# Altium project TYPEC_4KTransmitter-v1.0.PrjPcb (part 11 of 11)
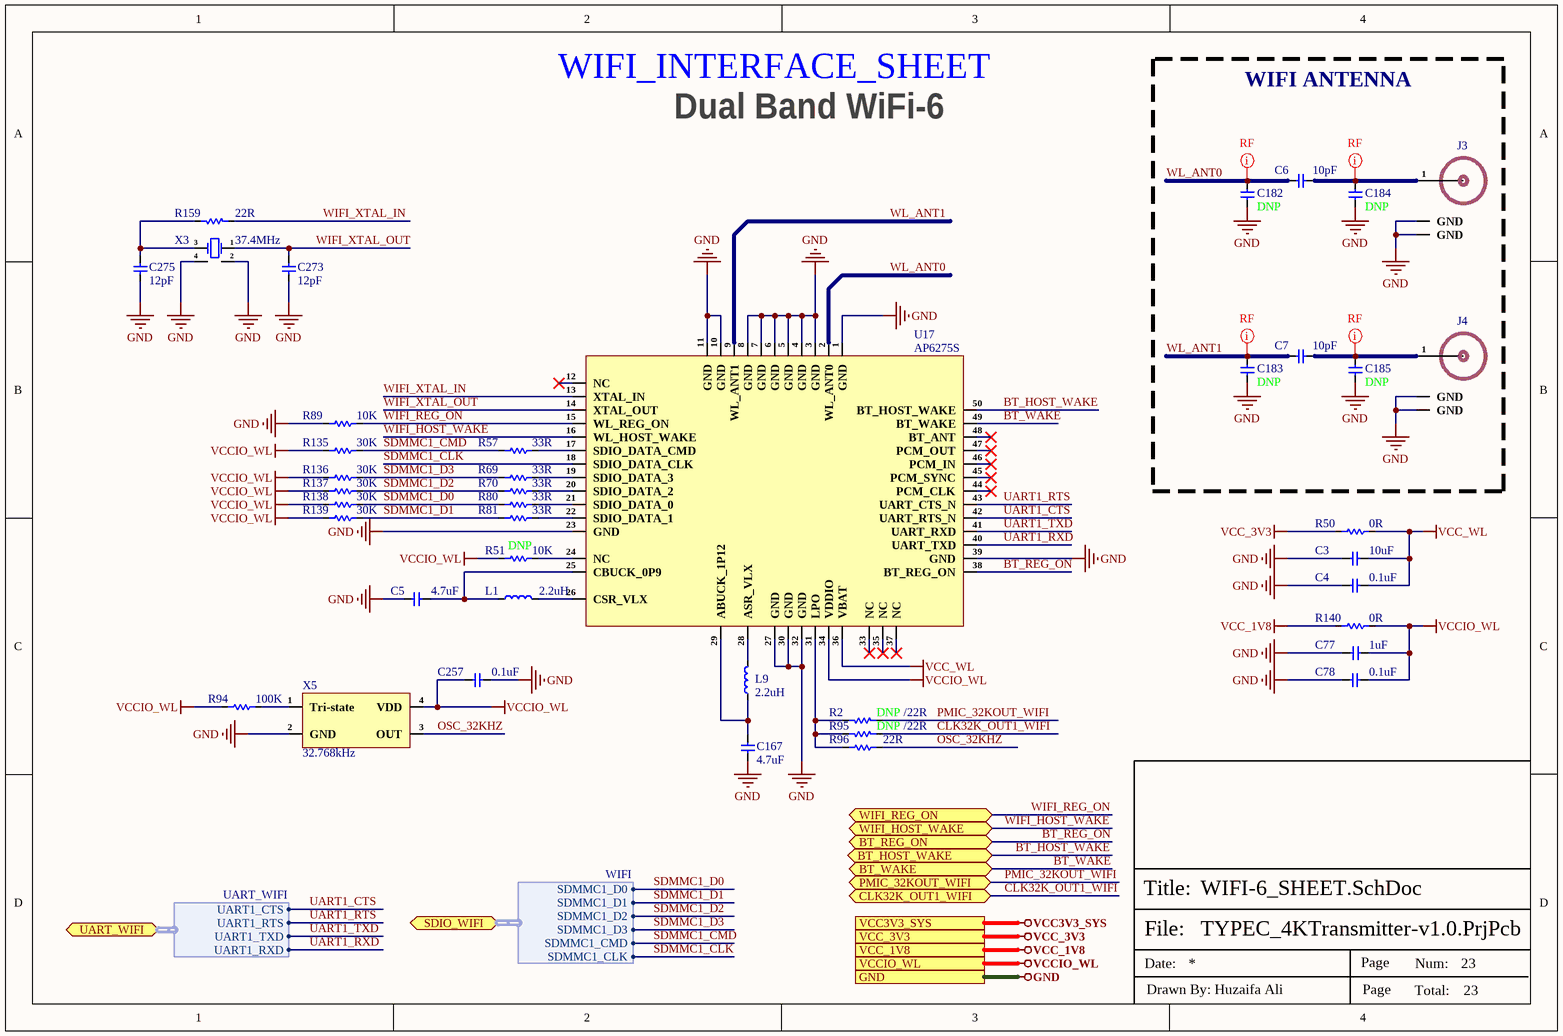
[diagram p24: WIFI-6_SHEET.SchDoc]

## Nets that join several sheets
GND: TYPE-C_INTERFACE_SHEET (13 pins), POWER_LDO_SHEET (12 pins), POWER_OTHER_SHEET (17 pins), POWER_PMIC_RK809_DC DC (14 pins), POWER_PMIC_RK809_LDO (18 pins), POWER_PMIC_RK809_MGM (17 pins), POWER_PMIC_RK809_CODEC (5 pins), RK3566_POWER_SHEET (207 pins), RK3566_DDR-PHY_SHEET (11 pins), RK3566_OSC_PMUIO_SHEET (31 pins), RK3566_FLASH-SD_SHEET (C107.1 C133.1 C134.1), RK3566_SARADC_GPIO (9 pins), RK3566_USB_PCIe_SHEET (12 pins), RK3566_VI_SHEET (5 pins), RK3566_VO_SHEET_1 (12 pins), RK3566_VO_SHEET_2 (C151.1), RK3566_AUDIO_SHEET (C180.1 C181.1), DRAM_LPDDR4_SHEET (115 pins), eMMC_SPI-FLASH_SHEET (22 pins), TYPE-C_TO_MIPI-CSI_SHEET (34 pins), HDMI2.0_SHEET (12 pins), USB2.0_SHEET (14 pins), WIFI-6_SHEET (35 pins)
VCC0V6_DDR: RK3566_DDR-PHY_SHEET (10 pins), DRAM_LPDDR4_SHEET (50 pins)
VCC3V3_PMU: POWER_OTHER_SHEET (R12.2), POWER_PMIC_RK809_LDO (C20.2 U7.31), POWER_PMIC_RK809_MGM (R6.1 R7.1 R109.1), RK3566_OSC_PMUIO_SHEET (5 pins)
VCC3V3_SYS: POWER_LDO_SHEET (6 pins), POWER_OTHER_SHEET (C290.2 U16.1 U16.4), POWER_PMIC_RK809_DC DC (8 pins), POWER_PMIC_RK809_LDO (10 pins), POWER_PMIC_RK809_MGM (C32.2 U7.45), RK3566_OSC_PMUIO_SHEET (LED1.2 LED1.4), DRAM_LPDDR4_SHEET (C196.2 U11.4), TYPE-C_TO_MIPI-CSI_SHEET (FB1.1 FB2.1 R110.1)
VCC5V0_SYS: TYPE-C_INTERFACE_SHEET (C85.2 C86.2 F1.2), POWER_LDO_SHEET (6 pins), POWER_OTHER_SHEET (6 pins), POWER_PMIC_RK809_MGM (R5.2), POWER_PMIC_RK809_CODEC (C38.1 U7.33), RK3566_USB_PCIe_SHEET (R17.2), HDMI2.0_SHEET (C175.1 U2.10), USB2.0_SHEET (C164.2 U8.3)
VCC_1V2: POWER_OTHER_SHEET (5 pins), TYPE-C_TO_MIPI-CSI_SHEET (FB3.1 FB4.1 FB5.1 FB6.1)
VCC_1V8: POWER_PMIC_RK809_LDO (C28.2 C29.2 L5.2 R3.2), RK3566_FLASH-SD_SHEET (R87.1), RK3566_VI_SHEET (R93.2 R111.1 R112.1), WIFI-6_SHEET (R140.1)
VCC_3V3: POWER_PMIC_RK809_LDO (C27.2 U7.55), RK3566_USB_PCIe_SHEET (C137.2 C147.2 U1.1H18 U1.1J2), RK3566_VO_SHEET_2 (R29.2), RK3566_AUDIO_SHEET (C181.2 U1.1N8), eMMC_SPI-FLASH_SHEET (7 pins), HDMI2.0_SHEET (C176.2 R76.2 R77.2 U2.23), WIFI-6_SHEET (R50.1)
VCC_DDR: POWER_PMIC_RK809_DC DC (5 pins), RK3566_DDR-PHY_SHEET (14 pins), DRAM_LPDDR4_SHEET (45 pins)
VCCA1V8_IMAGE: POWER_PMIC_RK809_LDO (C24.2 U7.6), RK3566_VI_SHEET (C168.2 C169.1 U1.1P9), RK3566_VO_SHEET_1 (9 pins)
VCCA1V8_PMU: POWER_PMIC_RK809_LDO (C23.2 U7.5), RK3566_OSC_PMUIO_SHEET (C120.1 C125.2 R82.1 U1.1N18), DRAM_LPDDR4_SHEET (R104.1)
VCCA_1V8: POWER_PMIC_RK809_LDO (C21.2 U7.3), RK3566_OSC_PMUIO_SHEET (C122.1 C127.2 U1.1H4), RK3566_SARADC_GPIO (8 pins), RK3566_USB_PCIe_SHEET (7 pins)
VCCIO_ACODEC: POWER_PMIC_RK809_LDO (C17.2 U7.28), RK3566_AUDIO_SHEET (C180.2 U1.1D13)
VCCIO_FLASH: RK3566_FLASH-SD_SHEET (C133.2 C134.2 R87.2 U1.1C13), eMMC_SPI-FLASH_SHEET (13 pins)
VCCIO_SD: POWER_PMIC_RK809_LDO (C19.2 U7.29), RK3566_FLASH-SD_SHEET (C107.2 U1.1F17)
VCCIO_WL: POWER_PMIC_RK809_MGM (R9.1), RK3566_SARADC_GPIO (C150.2 U1.1E16), WIFI-6_SHEET (13 pins)
VDD_CPU: POWER_OTHER_SHEET (9 pins), RK3566_POWER_SHEET (18 pins)
VDD_GPU: POWER_PMIC_RK809_DC DC (8 pins), RK3566_POWER_SHEET (10 pins)
VDD_LOGIC: POWER_PMIC_RK809_DC DC (8 pins), RK3566_POWER_SHEET (16 pins)
VDD_NPU: POWER_PMIC_RK809_DC DC (8 pins), RK3566_POWER_SHEET (9 pins)
VDDA0V9_IMAGE: POWER_PMIC_RK809_LDO (C13.2 U7.23), RK3566_VI_SHEET (C148.2 C149.1 U1.1N9), RK3566_VO_SHEET_1 (10 pins)
VDDA0V9_PMU: POWER_PMIC_RK809_LDO (C16.2 U7.20), RK3566_OSC_PMUIO_SHEET (6 pins)
VDDA_0V9: POWER_PMIC_RK809_LDO (C15.2 U7.21), RK3566_OSC_PMUIO_SHEET (C121.1 C126.2 U1.1H5), RK3566_USB_PCIe_SHEET (7 pins)
AUX_N: TYPE-C_INTERFACE_SHEET (R114.1), TYPE-C_TO_MIPI-CSI_SHEET (U4.18)
AUX_P: TYPE-C_INTERFACE_SHEET (R115.1), TYPE-C_TO_MIPI-CSI_SHEET (U4.17)
BT_HOST_WAKE: RK3566_SARADC_GPIO (U1.A37), WIFI-6_SHEET (U17.50)
BT_REG_ON: RK3566_SARADC_GPIO (U1.D38), WIFI-6_SHEET (U17.38)
BT_WAKE: RK3566_SARADC_GPIO (U1.B36), WIFI-6_SHEET (U17.49)
CLK32K_OUT1_WIFI: RK3566_SARADC_GPIO (U1.B38), WIFI-6_SHEET (R95.1)
eMMC_CLK: RK3566_FLASH-SD_SHEET (R53.1), eMMC_SPI-FLASH_SHEET (U3.M6)
eMMC_CMD: RK3566_FLASH-SD_SHEET (U1.A27), eMMC_SPI-FLASH_SHEET (R106.2 U3.M5)
eMMC_DATA0: RK3566_FLASH-SD_SHEET (U1.A32), eMMC_SPI-FLASH_SHEET (R105.2 U3.A3)
eMMC_DATA1: RK3566_FLASH-SD_SHEET (U1.B27), eMMC_SPI-FLASH_SHEET (U3.A4)
eMMC_DATA2: RK3566_FLASH-SD_SHEET (U1.B32), eMMC_SPI-FLASH_SHEET (U3.A5)
eMMC_DATA3: RK3566_FLASH-SD_SHEET (U1.B29), eMMC_SPI-FLASH_SHEET (U3.B2)
eMMC_DATA4: RK3566_FLASH-SD_SHEET (U1.B33), eMMC_SPI-FLASH_SHEET (U3.B3)
eMMC_DATA5: RK3566_FLASH-SD_SHEET (U1.A30), eMMC_SPI-FLASH_SHEET (U3.B4)
eMMC_DATA6: RK3566_FLASH-SD_SHEET (U1.B30), eMMC_SPI-FLASH_SHEET (U3.B5)
eMMC_DATA7: RK3566_FLASH-SD_SHEET (U1.A33), eMMC_SPI-FLASH_SHEET (U3.B6)
eMMC_DATA_STROBE: RK3566_FLASH-SD_SHEET (U1.1A16), eMMC_SPI-FLASH_SHEET (R56.1)
eMMC_RSTN: RK3566_FLASH-SD_SHEET (U1.1B16), eMMC_SPI-FLASH_SHEET (R28.1)
HDMI_TX0_N: RK3566_VO_SHEET_1 (R67.2), HDMI2.0_SHEET (J7.11 U2.16)
HDMI_TX0_P: RK3566_VO_SHEET_1 (R66.2), HDMI2.0_SHEET (J7.9 U2.17)
HDMI_TX1_N: RK3566_VO_SHEET_1 (R65.2), HDMI2.0_SHEET (J7.8 U2.19)
HDMI_TX1_P: RK3566_VO_SHEET_1 (R64.2), HDMI2.0_SHEET (J7.6 U2.20)
HDMI_TX2_N: RK3566_VO_SHEET_1 (R59.2), HDMI2.0_SHEET (J7.5 U2.21)
HDMI_TX2_P: RK3566_VO_SHEET_1 (R58.2), HDMI2.0_SHEET (J7.3 U2.22)
HDMI_TXCLK_N: RK3566_VO_SHEET_1 (R72.2), HDMI2.0_SHEET (J7.14 U2.14)
HDMI_TXCLK_P: RK3566_VO_SHEET_1 (R71.2), HDMI2.0_SHEET (J7.12 U2.15)
HDMITX_CEC: RK3566_AUDIO_SHEET (U1.1V5), HDMI2.0_SHEET (U2.24)
HDMITX_HPD: RK3566_VO_SHEET_1 (C170.2 U1.1V17), HDMI2.0_SHEET (U2.3)
HDMITX_SCL: RK3566_AUDIO_SHEET (U1.AR12), HDMI2.0_SHEET (U2.1)
HDMITX_SDA: RK3566_AUDIO_SHEET (U1.AP11), HDMI2.0_SHEET (U2.2)
I2C0_SCL_PMIC: POWER_OTHER_SHEET (U5.A3), POWER_PMIC_RK809_MGM (R7.2 U7.1), RK3566_OSC_PMUIO_SHEET (U1.AJ37)
I2C0_SDA_PMIC: POWER_OTHER_SHEET (U5.B1), POWER_PMIC_RK809_MGM (R6.2 U7.2), RK3566_OSC_PMUIO_SHEET (U1.AK38)
I2C4_SCL_M1: RK3566_VI_SHEET (R111.2 U1.AE2), TYPE-C_TO_MIPI-CSI_SHEET (R125.1)
I2C4_SDA_M1: RK3566_VI_SHEET (R112.2 U1.AF2), TYPE-C_TO_MIPI-CSI_SHEET (R126.1)
I2S1_LRCK_TX_M0: POWER_PMIC_RK809_CODEC (U7.14), RK3566_AUDIO_SHEET (U1.B24)
I2S1_MCLK_M0: POWER_PMIC_RK809_CODEC (U7.16), RK3566_AUDIO_SHEET (U1.A23)
I2S1_SCLK_TX_M0: POWER_PMIC_RK809_CODEC (U7.15), RK3566_AUDIO_SHEET (U1.B23)
I2S1_SDI0_M0: POWER_PMIC_RK809_CODEC (U7.18), RK3566_AUDIO_SHEET (U1.1B14)
I2S1_SDO0_M0: POWER_PMIC_RK809_CODEC (U7.17), RK3566_AUDIO_SHEET (U1.B25)
I2S3_LRCK_M1: RK3566_AUDIO_SHEET (R121.2), TYPE-C_TO_MIPI-CSI_SHEET (U4.27)
I2S3_MCLK_M1: RK3566_AUDIO_SHEET (R119.2), TYPE-C_TO_MIPI-CSI_SHEET (U4.29)
I2S3_SCLK_M1: RK3566_AUDIO_SHEET (R120.2), TYPE-C_TO_MIPI-CSI_SHEET (U4.28)
I2S3_SDO_M1: RK3566_AUDIO_SHEET (R123.2), TYPE-C_TO_MIPI-CSI_SHEET (U4.32)
LANE0_RX1_N: TYPE-C_INTERFACE_SHEET (R171.1), TYPE-C_TO_MIPI-CSI_SHEET (U4.3)
LANE0_RX1_P: TYPE-C_INTERFACE_SHEET (R172.1), TYPE-C_TO_MIPI-CSI_SHEET (U4.2)
LANE1_TX1_N: TYPE-C_INTERFACE_SHEET (R169.1), TYPE-C_TO_MIPI-CSI_SHEET (U4.6)
LANE1_TX1_P: TYPE-C_INTERFACE_SHEET (R170.1), TYPE-C_TO_MIPI-CSI_SHEET (U4.5)
LANE2_RX2_N: TYPE-C_INTERFACE_SHEET (R176.1), TYPE-C_TO_MIPI-CSI_SHEET (U4.9)
LANE2_RX2_P: TYPE-C_INTERFACE_SHEET (R175.1), TYPE-C_TO_MIPI-CSI_SHEET (U4.8)
LANE3_TX2_N: TYPE-C_INTERFACE_SHEET (R173.1), TYPE-C_TO_MIPI-CSI_SHEET (U4.12)
LANE3_TX2_P: TYPE-C_INTERFACE_SHEET (R174.1), TYPE-C_TO_MIPI-CSI_SHEET (U4.11)
LPDDR4_A0_A: RK3566_DDR-PHY_SHEET (U1.C2), DRAM_LPDDR4_SHEET (U12.H2)
LPDDR4_A0_B: RK3566_DDR-PHY_SHEET (U1.A9), DRAM_LPDDR4_SHEET (U12.R2)
LPDDR4_A1_A: RK3566_DDR-PHY_SHEET (U1.C1), DRAM_LPDDR4_SHEET (U12.J2)
LPDDR4_A1_B: RK3566_DDR-PHY_SHEET (U1.B9), DRAM_LPDDR4_SHEET (U12.P2)
LPDDR4_A2_A: RK3566_DDR-PHY_SHEET (U1.1C1), DRAM_LPDDR4_SHEET (U12.H9)
LPDDR4_A2_B: RK3566_DDR-PHY_SHEET (U1.1B7), DRAM_LPDDR4_SHEET (U12.R9)
LPDDR4_A3_A: RK3566_DDR-PHY_SHEET (U1.1B3), DRAM_LPDDR4_SHEET (U12.H10)
LPDDR4_A3_B: RK3566_DDR-PHY_SHEET (U1.1B6), DRAM_LPDDR4_SHEET (U12.R10)
LPDDR4_A4_A: RK3566_DDR-PHY_SHEET (U1.1B1), DRAM_LPDDR4_SHEET (U12.H11)
LPDDR4_A4_B: RK3566_DDR-PHY_SHEET (U1.1A6), DRAM_LPDDR4_SHEET (U12.R11)
LPDDR4_A5_A: RK3566_DDR-PHY_SHEET (U1.1A1), DRAM_LPDDR4_SHEET (U12.J11)
LPDDR4_A5_B: RK3566_DDR-PHY_SHEET (U1.B8), DRAM_LPDDR4_SHEET (U12.P11)
LPDDR4_CKE0_A: RK3566_DDR-PHY_SHEET (U1.B4), DRAM_LPDDR4_SHEET (U12.J4)
LPDDR4_CKE0_B: RK3566_DDR-PHY_SHEET (U1.1A3), DRAM_LPDDR4_SHEET (U12.P4)
LPDDR4_CKE1_A: RK3566_DDR-PHY_SHEET (U1.1C3), DRAM_LPDDR4_SHEET (U12.J5)
LPDDR4_CKE1_B: RK3566_DDR-PHY_SHEET (U1.1A2), DRAM_LPDDR4_SHEET (U12.P5)
LPDDR4_CLK_A_N: RK3566_DDR-PHY_SHEET (U1.B5), DRAM_LPDDR4_SHEET (U12.J9)
LPDDR4_CLK_A_P: RK3566_DDR-PHY_SHEET (U1.A5), DRAM_LPDDR4_SHEET (U12.J8)
LPDDR4_CLK_B_N: RK3566_DDR-PHY_SHEET (U1.B7), DRAM_LPDDR4_SHEET (U12.P9)
LPDDR4_CLK_B_P: RK3566_DDR-PHY_SHEET (U1.A7), DRAM_LPDDR4_SHEET (U12.P8)
LPDDR4_CS0n_A: RK3566_DDR-PHY_SHEET (U1.B3), DRAM_LPDDR4_SHEET (U12.H4)
LPDDR4_CS0n_B: RK3566_DDR-PHY_SHEET (U1.1B5), DRAM_LPDDR4_SHEET (U12.R4)
LPDDR4_CS1n_A: RK3566_DDR-PHY_SHEET (U1.A3), DRAM_LPDDR4_SHEET (U12.H3)
LPDDR4_CS1n_B: RK3566_DDR-PHY_SHEET (U1.1A5), DRAM_LPDDR4_SHEET (U12.R3)
LPDDR4_DM0_A: RK3566_DDR-PHY_SHEET (U1.1E2), DRAM_LPDDR4_SHEET (U12.C3)
LPDDR4_DM0_B: RK3566_DDR-PHY_SHEET (U1.1B8), DRAM_LPDDR4_SHEET (U12.Y3)
LPDDR4_DM1_A: RK3566_DDR-PHY_SHEET (U1.1G1), DRAM_LPDDR4_SHEET (U12.C10)
LPDDR4_DM1_B: RK3566_DDR-PHY_SHEET (U1.1A11), DRAM_LPDDR4_SHEET (U12.Y10)
LPDDR4_DQ0_A: RK3566_DDR-PHY_SHEET (U1.G2), DRAM_LPDDR4_SHEET (U12.B2)
LPDDR4_DQ0_B: RK3566_DDR-PHY_SHEET (U1.B12), DRAM_LPDDR4_SHEET (U12.AA2)
LPDDR4_DQ1_A: RK3566_DDR-PHY_SHEET (U1.F2), DRAM_LPDDR4_SHEET (U12.C2)
LPDDR4_DQ1_B: RK3566_DDR-PHY_SHEET (U1.B10), DRAM_LPDDR4_SHEET (U12.Y2)
LPDDR4_DQ2_A: RK3566_DDR-PHY_SHEET (U1.F1), DRAM_LPDDR4_SHEET (U12.E2)
LPDDR4_DQ2_B: RK3566_DDR-PHY_SHEET (U1.1A8), DRAM_LPDDR4_SHEET (U12.V2)
LPDDR4_DQ3_A: RK3566_DDR-PHY_SHEET (U1.E1), DRAM_LPDDR4_SHEET (U12.F2)
LPDDR4_DQ3_B: RK3566_DDR-PHY_SHEET (U1.1A7), DRAM_LPDDR4_SHEET (U12.U2)
LPDDR4_DQ4_A: RK3566_DDR-PHY_SHEET (U1.M2), DRAM_LPDDR4_SHEET (U12.F4)
LPDDR4_DQ4_B: RK3566_DDR-PHY_SHEET (U1.B13), DRAM_LPDDR4_SHEET (U12.U4)
LPDDR4_DQ5_A: RK3566_DDR-PHY_SHEET (U1.K1), DRAM_LPDDR4_SHEET (U12.E4)
LPDDR4_DQ5_B: RK3566_DDR-PHY_SHEET (U1.1A10), DRAM_LPDDR4_SHEET (U12.V4)
LPDDR4_DQ6_A: RK3566_DDR-PHY_SHEET (U1.K2), DRAM_LPDDR4_SHEET (U12.C4)
LPDDR4_DQ6_B: RK3566_DDR-PHY_SHEET (U1.1B9), DRAM_LPDDR4_SHEET (U12.Y4)
LPDDR4_DQ7_A: RK3566_DDR-PHY_SHEET (U1.1E1), DRAM_LPDDR4_SHEET (U12.B4)
LPDDR4_DQ7_B: RK3566_DDR-PHY_SHEET (U1.1A9), DRAM_LPDDR4_SHEET (U12.AA4)
LPDDR4_DQ8_A: RK3566_DDR-PHY_SHEET (U1.P2), DRAM_LPDDR4_SHEET (U12.B11)
LPDDR4_DQ8_B: RK3566_DDR-PHY_SHEET (U1.B19), DRAM_LPDDR4_SHEET (U12.AA11)
LPDDR4_DQ9_A: RK3566_DDR-PHY_SHEET (U1.R1), DRAM_LPDDR4_SHEET (U12.C11)
LPDDR4_DQ9_B: RK3566_DDR-PHY_SHEET (U1.A19), DRAM_LPDDR4_SHEET (U12.Y11)
LPDDR4_DQ10_A: RK3566_DDR-PHY_SHEET (U1.R2), DRAM_LPDDR4_SHEET (U12.E11)
LPDDR4_DQ10_B: RK3566_DDR-PHY_SHEET (U1.A20), DRAM_LPDDR4_SHEET (U12.V11)
LPDDR4_DQ11_A: RK3566_DDR-PHY_SHEET (U1.T2), DRAM_LPDDR4_SHEET (U12.F11)
LPDDR4_DQ11_B: RK3566_DDR-PHY_SHEET (U1.B20), DRAM_LPDDR4_SHEET (U12.U11)
LPDDR4_DQ12_A: RK3566_DDR-PHY_SHEET (U1.M1), DRAM_LPDDR4_SHEET (U12.F9)
LPDDR4_DQ12_B: RK3566_DDR-PHY_SHEET (U1.A15), DRAM_LPDDR4_SHEET (U12.U9)
LPDDR4_DQ13_A: RK3566_DDR-PHY_SHEET (U1.1F2), DRAM_LPDDR4_SHEET (U12.E9)
LPDDR4_DQ13_B: RK3566_DDR-PHY_SHEET (U1.B15), DRAM_LPDDR4_SHEET (U12.V9)
LPDDR4_DQ14_A: RK3566_DDR-PHY_SHEET (U1.1F1), DRAM_LPDDR4_SHEET (U12.C9)
LPDDR4_DQ14_B: RK3566_DDR-PHY_SHEET (U1.1C10), DRAM_LPDDR4_SHEET (U12.Y9)
LPDDR4_DQ15_A: RK3566_DDR-PHY_SHEET (U1.1G2), DRAM_LPDDR4_SHEET (U12.B9)
LPDDR4_DQ15_B: RK3566_DDR-PHY_SHEET (U1.B16), DRAM_LPDDR4_SHEET (U12.AA9)
LPDDR4_DQS0_A_N: RK3566_DDR-PHY_SHEET (U1.H1), DRAM_LPDDR4_SHEET (U12.E3)
LPDDR4_DQS0_A_P: RK3566_DDR-PHY_SHEET (U1.H2), DRAM_LPDDR4_SHEET (U12.D3)
LPDDR4_DQS0_B_N: RK3566_DDR-PHY_SHEET (U1.A12), DRAM_LPDDR4_SHEET (U12.V3)
LPDDR4_DQS0_B_P: RK3566_DDR-PHY_SHEET (U1.A13), DRAM_LPDDR4_SHEET (U12.W3)
LPDDR4_DQS1_A_N: RK3566_DDR-PHY_SHEET (U1.N2), DRAM_LPDDR4_SHEET (U12.E10)
LPDDR4_DQS1_A_P: RK3566_DDR-PHY_SHEET (U1.N1), DRAM_LPDDR4_SHEET (U12.D10)
LPDDR4_DQS1_B_N: RK3566_DDR-PHY_SHEET (U1.B17), DRAM_LPDDR4_SHEET (U12.V10)
LPDDR4_DQS1_B_P: RK3566_DDR-PHY_SHEET (U1.A17), DRAM_LPDDR4_SHEET (U12.W10)
LPDDR4_ODT0_CA_A: RK3566_DDR-PHY_SHEET (U1.E2), DRAM_LPDDR4_SHEET (U12.G2)
LPDDR4_ODT0_CA_B: RK3566_DDR-PHY_SHEET (U1.A10), DRAM_LPDDR4_SHEET (U12.T2)
LPDDR4_RESETn: RK3566_DDR-PHY_SHEET (U1.1C7), DRAM_LPDDR4_SHEET (C238.2 U12.T11)
MIPI_CSI_RX_CLK0_N: RK3566_VI_SHEET (U1.1U9), TYPE-C_TO_MIPI-CSI_SHEET (U4.54)
MIPI_CSI_RX_CLK0_P: RK3566_VI_SHEET (U1.1V9), TYPE-C_TO_MIPI-CSI_SHEET (U4.53)
MIPI_CSI_RX_D0_N: RK3566_VI_SHEET (U1.AR18), TYPE-C_TO_MIPI-CSI_SHEET (U4.50)
MIPI_CSI_RX_D0_P: RK3566_VI_SHEET (U1.AP18), TYPE-C_TO_MIPI-CSI_SHEET (U4.49)
MIPI_CSI_RX_D1_N: RK3566_VI_SHEET (U1.AP17), TYPE-C_TO_MIPI-CSI_SHEET (U4.52)
MIPI_CSI_RX_D1_P: RK3566_VI_SHEET (U1.AR17), TYPE-C_TO_MIPI-CSI_SHEET (U4.51)
MIPI_CSI_RX_D2_N: RK3566_VI_SHEET (U1.AR15), TYPE-C_TO_MIPI-CSI_SHEET (U4.56)
MIPI_CSI_RX_D2_P: RK3566_VI_SHEET (U1.AP15), TYPE-C_TO_MIPI-CSI_SHEET (U4.55)
MIPI_CSI_RX_D3_N: RK3566_VI_SHEET (U1.AP14), TYPE-C_TO_MIPI-CSI_SHEET (U4.58)
MIPI_CSI_RX_D3_P: RK3566_VI_SHEET (U1.AR14), TYPE-C_TO_MIPI-CSI_SHEET (U4.57)
NetC33_2: POWER_PMIC_RK809_MGM (C33.2 R37.1 R109.2 U7.67), RK3566_OSC_PMUIO_SHEET (C128.2 R45.1 U1.AG38)
NetR124_1: RK3566_VI_SHEET (U1.1L2), TYPE-C_TO_MIPI-CSI_SHEET (R124.1)
PDM_CLK0_M0: POWER_PMIC_RK809_CODEC (U7.19), RK3566_AUDIO_SHEET (U1.1A14)
PMIC_32KOUT_WIFI: POWER_PMIC_RK809_MGM (R9.2 R10.2), WIFI-6_SHEET (R2.1)
PMIC_INT: POWER_PMIC_RK809_MGM (U7.7), RK3566_OSC_PMUIO_SHEET (U1.1R19)
PMIC_SLEEP: POWER_OTHER_SHEET (R13.2), POWER_PMIC_RK809_MGM (U7.49), RK3566_OSC_PMUIO_SHEET (U1.1P19)
SDMMC1_CLK: RK3566_SARADC_GPIO (R68.1), WIFI-6_SHEET (U17.18)
SDMMC1_CMD: RK3566_SARADC_GPIO (U1.B35), WIFI-6_SHEET (R57.1 R135.2)
SDMMC1_D0: RK3566_SARADC_GPIO (U1.1C19), WIFI-6_SHEET (R80.1 R138.2)
SDMMC1_D1: RK3566_SARADC_GPIO (U1.1E18), WIFI-6_SHEET (R81.1 R139.2)
SDMMC1_D2: RK3566_SARADC_GPIO (U1.1D18), WIFI-6_SHEET (R70.1 R137.2)
SDMMC1_D3: RK3566_SARADC_GPIO (U1.1A20), WIFI-6_SHEET (R69.1 R136.2)
TYPEC0_CC1: TYPE-C_INTERFACE_SHEET (R116.1), TYPE-C_TO_MIPI-CSI_SHEET (U4.14)
TYPEC0_CC2: TYPE-C_INTERFACE_SHEET (R117.1), TYPE-C_TO_MIPI-CSI_SHEET (U4.15)
UART1_CTS: RK3566_SARADC_GPIO (U1.G37), WIFI-6_SHEET (U17.42)
UART1_RTS: RK3566_SARADC_GPIO (U1.F37), WIFI-6_SHEET (U17.43)
UART1_RXD: RK3566_SARADC_GPIO (U1.1C20), WIFI-6_SHEET (U17.40)
UART1_TXD: RK3566_SARADC_GPIO (U1.F38), WIFI-6_SHEET (U17.41)
USB2_HOST2_D_N: RK3566_USB_PCIe_SHEET (U1.V1), USB2.0_SHEET (L8.2)
USB2_HOST2_D_P: RK3566_USB_PCIe_SHEET (U1.V2), USB2.0_SHEET (L8.1)
USB_OTG0_D_N: TYPE-C_INTERFACE_SHEET (L13.1), RK3566_USB_PCIe_SHEET (U1.R38)
USB_OTG0_D_P: TYPE-C_INTERFACE_SHEET (L13.2), RK3566_USB_PCIe_SHEET (U1.R37)
WIFI_HOST_WAKE: RK3566_SARADC_GPIO (U1.B34), WIFI-6_SHEET (U17.16)
WIFI_REG_ON: RK3566_SARADC_GPIO (U1.A35), WIFI-6_SHEET (R89.2 U17.15)